# Altium schematic sheet Groupe_SCH.SchDoc: Brain Board
size 297 x 209 mm; DrawnBy: Adnan CATAL; SheetNumber: 1; SheetTotal: 1; Designer: Adnan CATAL; Projet: Pamis; Title2: Main shematics
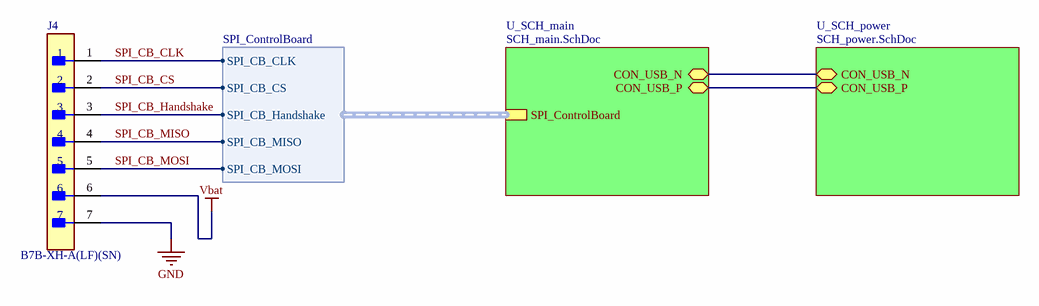
[diagram p0: Groupe_SCH.SchDoc]

## Parts
J4  B7B-XH-A(LF)(SN)  [FP-B7B-XH-A_LF_SN-MFG]

## Sub-sheets
U_SCH_main = SCH_main.SchDoc: SPI_ControlBoard (harness SPI_ControlBoard), CON_USB_P (bidir), CON_USB_N (bidir)
U_SCH_power = SCH_power.SchDoc: CON_USB_P (bidir), CON_USB_N (bidir)

## Harnesses
SPI_ControlBoard: SPI_CB_CLK, SPI_CB_CS, SPI_CB_Handshake, SPI_CB_MOSI, SPI_CB_MISO

## Nets
GND: J4.7
Vbat: J4.6
SPI_CB_CLK: J4.1 ; sheet U_SCH_main/SPI_ControlBoard.SPI_CB_CLK
SPI_CB_CS: J4.2 ; sheet U_SCH_main/SPI_ControlBoard.SPI_CB_CS
SPI_CB_Handshake: J4.3 ; sheet U_SCH_main/SPI_ControlBoard.SPI_CB_Handshake
SPI_CB_MISO: J4.4 ; sheet U_SCH_main/SPI_ControlBoard.SPI_CB_MISO
SPI_CB_MOSI: J4.5 ; sheet U_SCH_main/SPI_ControlBoard.SPI_CB_MOSI
(unnamed): sheet U_SCH_power/CON_USB_P, sheet U_SCH_main/CON_USB_P
(unnamed): sheet U_SCH_power/CON_USB_N, sheet U_SCH_main/CON_USB_N

## Notes on the sheet
- Project/Equipment
- Document
- Designer
- Drawn by
- Check.by
- File
- Last Mod.
- Print Date
- Sheet
- of
- Size
- A4
- Rev

## Library data of the parts
J4 = CMP-17439-000323-2: CONN HEADER VERT 7POS 2.5MM; Current Rating: 3A; Voltage Rating: 250V; Number of Contacts: 7; Mated Stacking Heights: 9.8mm; Insulation Resistance: 1GR; Contact Resistance: 20mR; Wire/Cable Gauge: 22AWG; Contact Finish - Mating: TIN; Orientation: Straight; REACH SVHC: No SVHC; Max Operating Temperature: 85°C; Housing Color: White; Pitch: 2.5mm; Mount: Through Hole; Packaging: Bulk; Depth: 5.75mm; Series: XH; Min Operating Temperature: -25°C; Length: 19.9mm; Connector Type: Header; Number of Positions: 7; Color: Natural; Max Current Rating: 3A; Lead Pitch: 2.5mm; Termination: Solder; Fastening Type: Detent; Flammability Rating: UL94 V-0; Voltage Rating (AC): 250V; Lead Free: Lead Free; Contact Material: Brass; Max Voltage Rating (AC): 250V; Contact Type: Male Pin; Housing Material: Polyamide; Insulation Color: Natural; Contact Shape: Square; Number of Rows: 1; Contact Plating: Tin; Insulation Material: Nylon